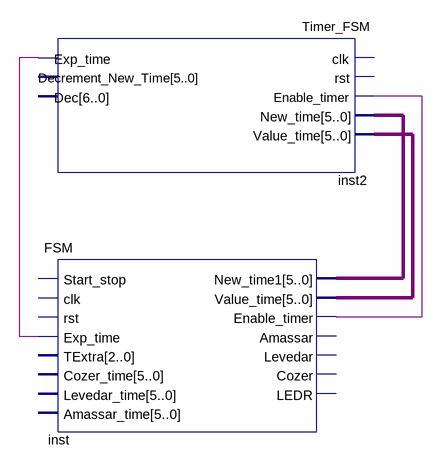
[diagram p0: schematic sheet]
// Quartus schematic Ruben.bdf as structural Verilog: 2 symbols, 0 pins
module Ruben (
);

  wire inst2_exp_time, inst_enable_timer;
  wire [5:0] inst_new_time1, inst_value_time;

  Timer_FSM inst2 (
    .Enable_timer(inst_enable_timer), .New_time(inst_new_time1), .Value_time(inst_value_time),
    .Exp_time(inst2_exp_time));  // open: clk, rst, Decrement_New_Time, Dec
  FSM inst (
    .Exp_time(inst2_exp_time), .New_time1(inst_new_time1), .Value_time(inst_value_time),
    .Enable_timer(inst_enable_timer));  // open: Start_stop, clk, rst, TExtra, Cozer_time, Levedar_time, Amassar_time, Amassar, Levedar, Cozer, LEDR
endmodule
